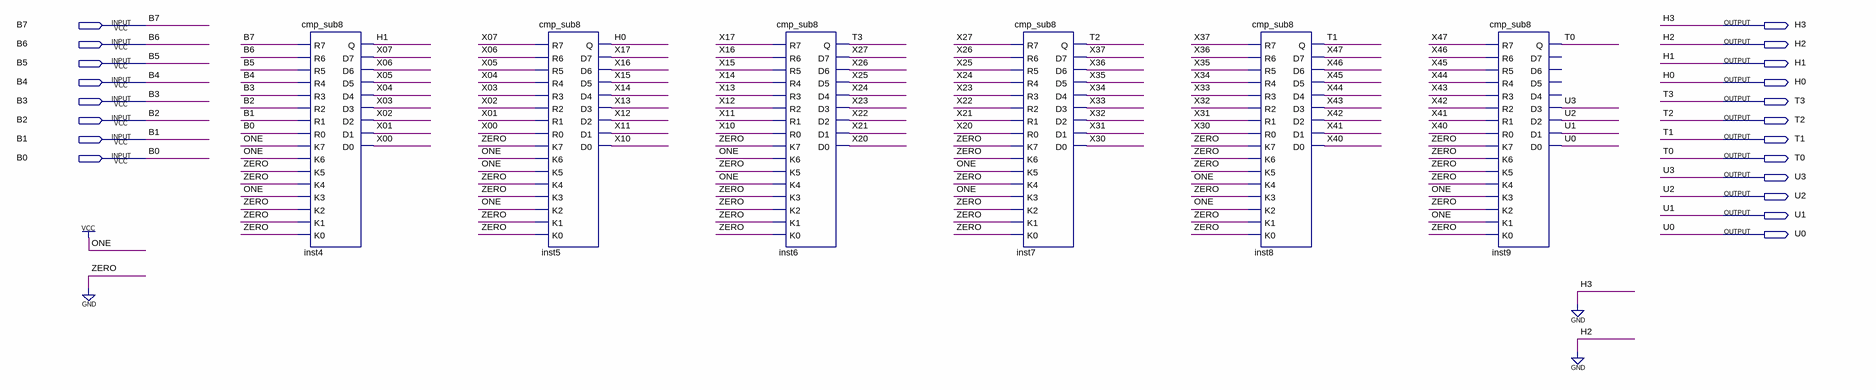
[diagram p0: schematic sheet]
// Quartus schematic bin8_bcd.bdf as structural Verilog: 6 symbols, 20 pins
module bin8_bcd (
  input  B7,
  input  B6,
  input  B5,
  input  B4,
  input  B3,
  input  B2,
  input  B1,
  input  B0,
  output H3,
  output H2,
  output H1,
  output H0,
  output T3,
  output T2,
  output T1,
  output T0,
  output U3,
  output U2,
  output U1,
  output U0
);

  wire X00, X01, X02, X03, X04, X05, X06, X07, X10, X11, X12, X13, X14, X15, X16, X17, X20, X21, X22, X23,
       X24, X25, X26, X27, X30, X31, X32, X33, X34, X35, X36, X37, X40, X41, X42, X43, X44, X45, X46, X47;

  cmp_sub8 inst4 (
    .R7(B7), .R6(B6), .R5(B5), .R4(B4), .R3(B3), .R2(B2), .R1(B1), .R0(B0), .K7(1'b1), .K6(1'b1), .K5(1'b0),
    .K4(1'b0), .K3(1'b1), .K2(1'b0), .K1(1'b0), .K0(1'b0), .Q(H1), .D7(X07), .D6(X06), .D5(X05), .D4(X04),
    .D3(X03), .D2(X02), .D1(X01), .D0(X00));
  cmp_sub8 inst5 (
    .R7(X07), .R6(X06), .R5(X05), .R4(X04), .R3(X03), .R2(X02), .R1(X01), .R0(X00), .K7(1'b0), .K6(1'b1),
    .K5(1'b1), .K4(1'b0), .K3(1'b0), .K2(1'b1), .K1(1'b0), .K0(1'b0), .Q(H0), .D7(X17), .D6(X16), .D5(X15),
    .D4(X14), .D3(X13), .D2(X12), .D1(X11), .D0(X10));
  cmp_sub8 inst6 (
    .R7(X17), .R6(X16), .R5(X15), .R4(X14), .R3(X13), .R2(X12), .R1(X11), .R0(X10), .K7(1'b0), .K6(1'b1),
    .K5(1'b0), .K4(1'b1), .K3(1'b0), .K2(1'b0), .K1(1'b0), .K0(1'b0), .Q(T3), .D7(X27), .D6(X26), .D5(X25),
    .D4(X24), .D3(X23), .D2(X22), .D1(X21), .D0(X20));
  cmp_sub8 inst7 (
    .R7(X27), .R6(X26), .R5(X25), .R4(X24), .R3(X23), .R2(X22), .R1(X21), .R0(X20), .K7(1'b0), .K6(1'b0),
    .K5(1'b1), .K4(1'b0), .K3(1'b1), .K2(1'b0), .K1(1'b0), .K0(1'b0), .Q(T2), .D7(X37), .D6(X36), .D5(X35),
    .D4(X34), .D3(X33), .D2(X32), .D1(X31), .D0(X30));
  cmp_sub8 inst8 (
    .R7(X37), .R6(X36), .R5(X35), .R4(X34), .R3(X33), .R2(X32), .R1(X31), .R0(X30), .K7(1'b0), .K6(1'b0),
    .K5(1'b0), .K4(1'b1), .K3(1'b0), .K2(1'b1), .K1(1'b0), .K0(1'b0), .Q(T1), .D7(X47), .D6(X46), .D5(X45),
    .D4(X44), .D3(X43), .D2(X42), .D1(X41), .D0(X40));
  cmp_sub8 inst9 (
    .R7(X47), .R6(X46), .R5(X45), .R4(X44), .R3(X43), .R2(X42), .R1(X41), .R0(X40), .K7(1'b0), .K6(1'b0),
    .K5(1'b0), .K4(1'b0), .K3(1'b1), .K2(1'b0), .K1(1'b1), .K0(1'b0), .Q(T0), .D3(U3), .D2(U2), .D1(U1),
    .D0(U0));  // open: D7, D6, D5, D4

  assign H2 = 1'b0;
  assign H3 = 1'b0;
endmodule
